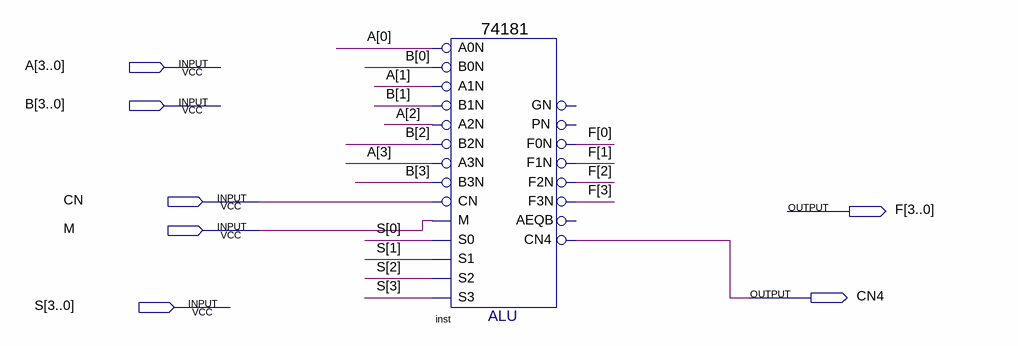
[diagram p0: schematic sheet]
// Quartus schematic alu_4_bit.bdf as structural Verilog: 1 symbols, 7 pins
module alu_4_bit (
  input  [3:0] A,
  input  [3:0] B,
  input  CN,
  input  M,
  input  [3:0] S,
  output [3:0] F,
  output CN4
);

  \74181  inst (
    .B0N(B[0]), .A0N(A[0]), .A1N(A[1]), .B1N(B[1]), .A3N(A[3]), .B2N(B[2]), .A2N(A[2]), .M(M), .CN(CN),
    .B3N(B[3]), .S2(S[2]), .S1(S[1]), .S0(S[0]), .S3(S[3]), .F3N(F[3]), .F1N(F[1]), .F0N(F[0]), .CN4(CN4),
    .F2N(F[2]));  // open: PN, GN, AEQB
endmodule
